# Altium schematic sheet Sheet1.SchDoc
size A3; SheetNumber: 1; SheetTotal: 1
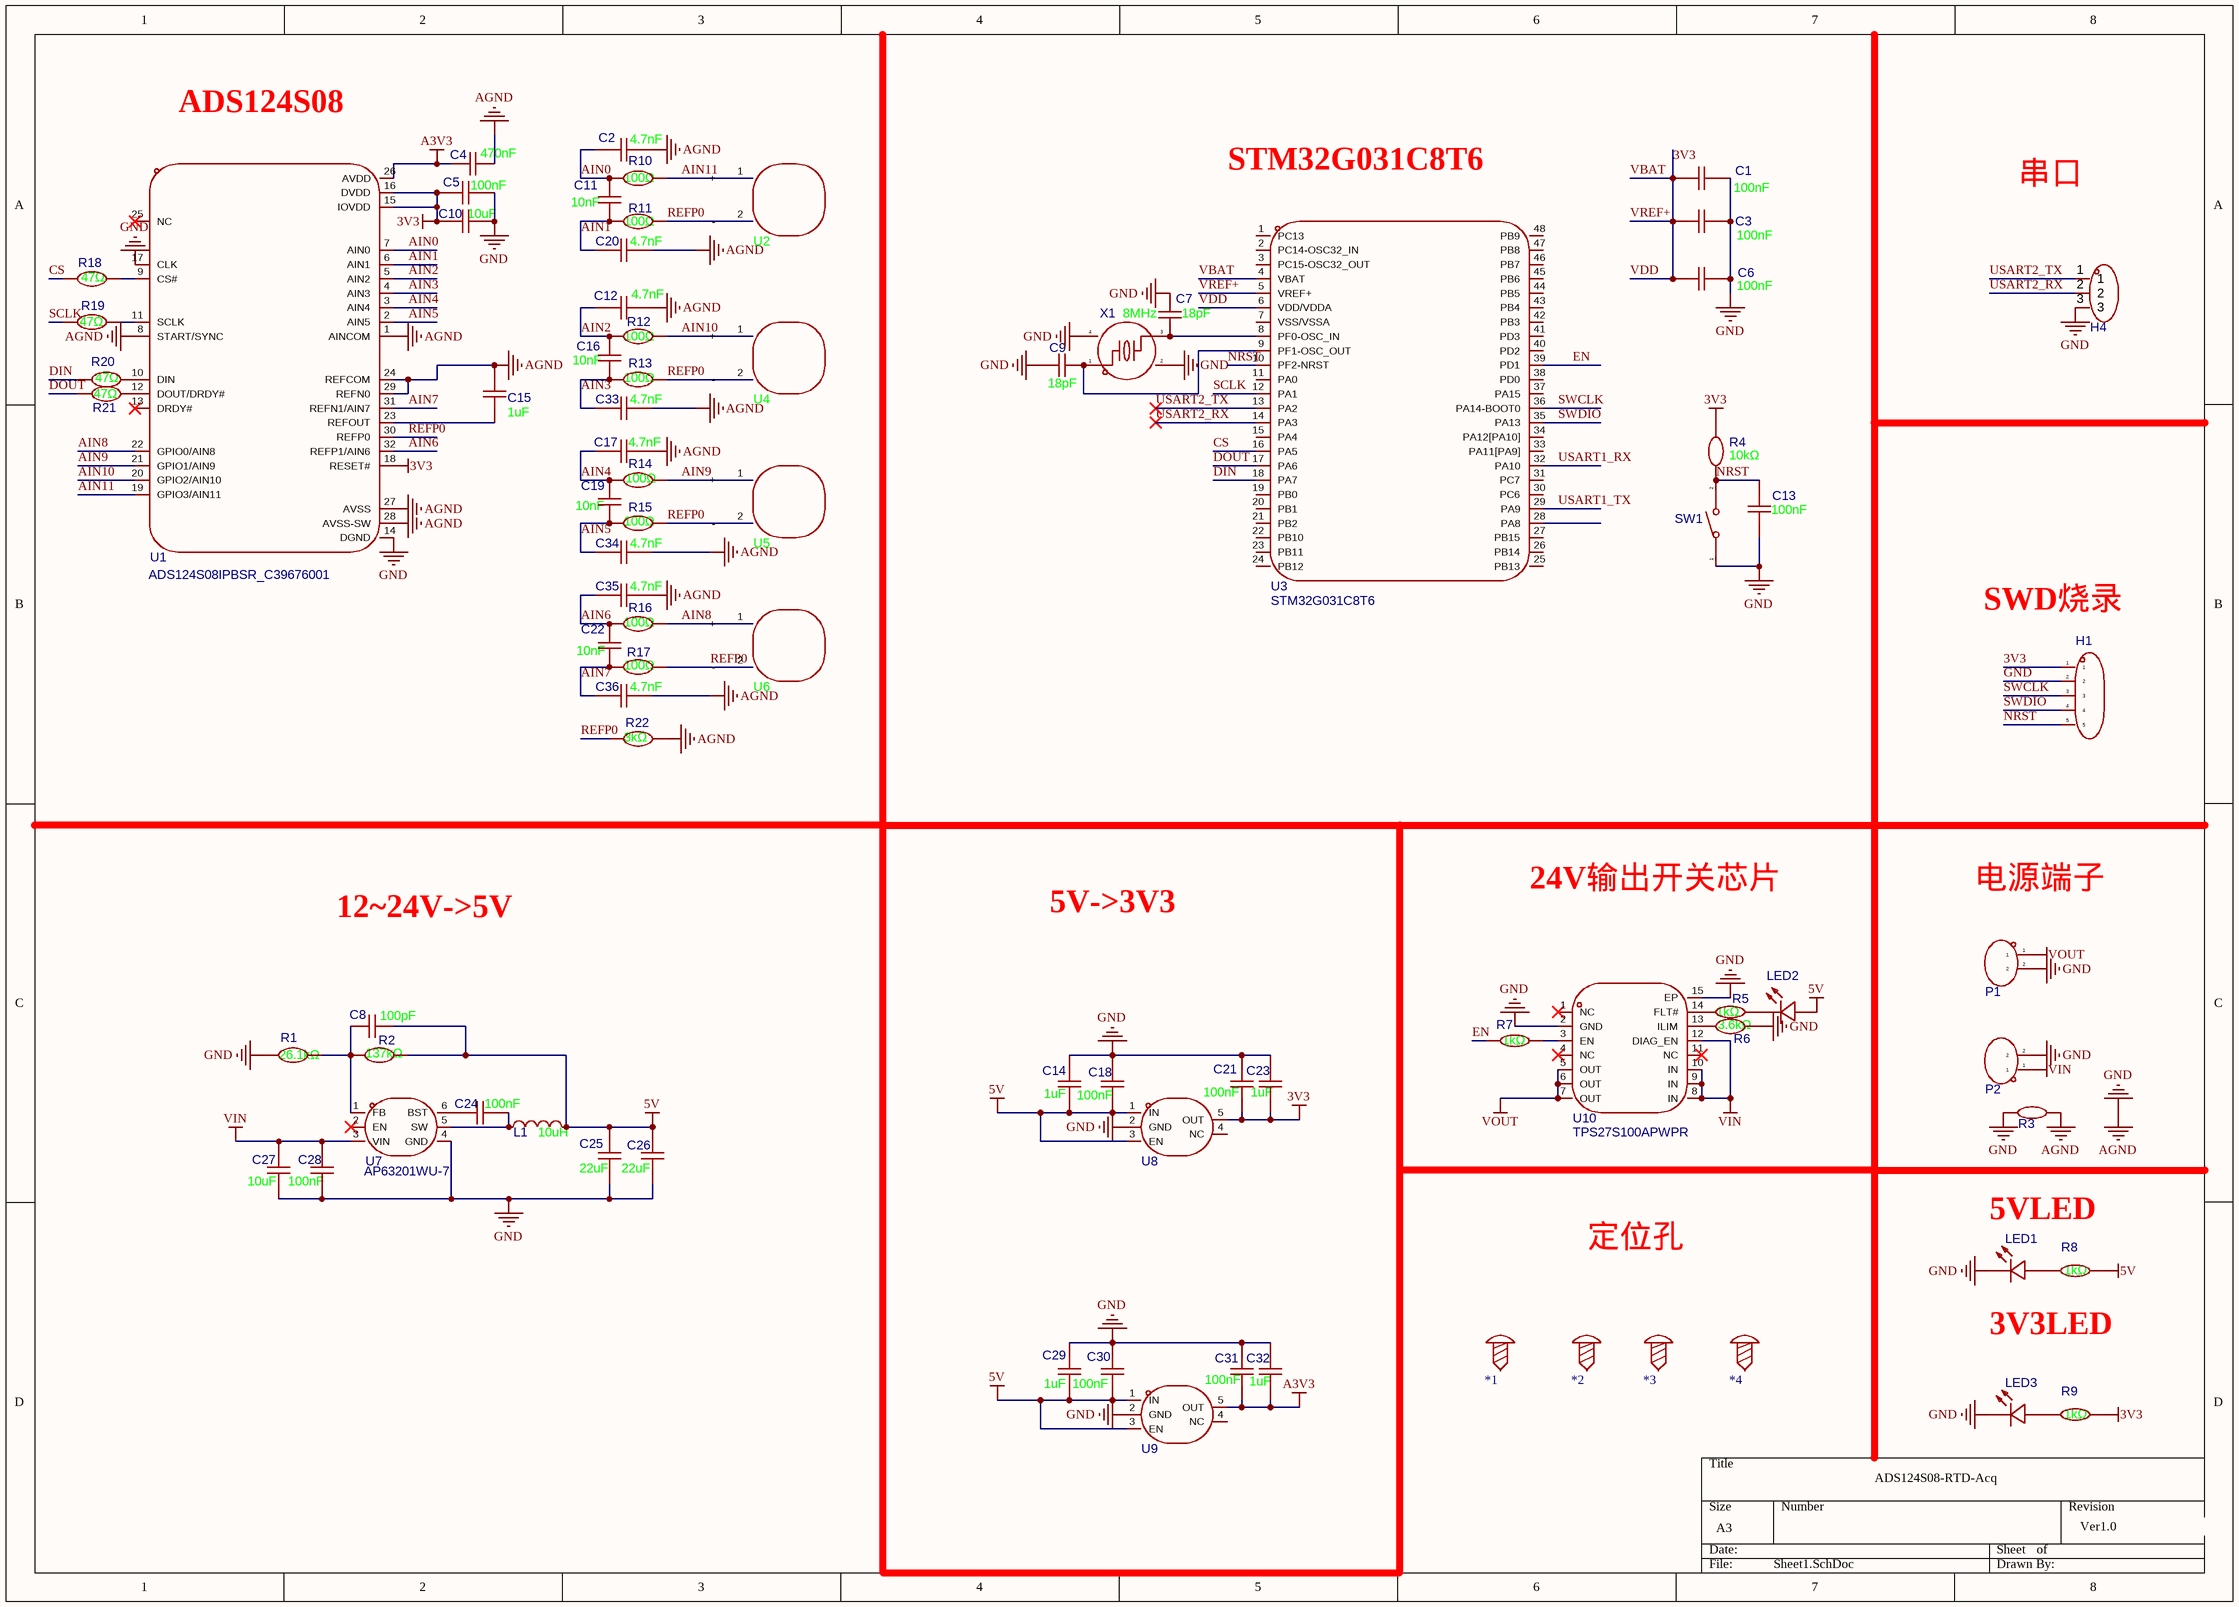
[diagram p0: Sheet1.SchDoc]

## Parts
*1  螺丝孔_1  [M3螺丝]  (value not drawn)
*2  螺丝孔_1  [M3螺丝]  (value not drawn)
*3  螺丝孔_1  [M3螺丝]  (value not drawn)
*4  螺丝孔_1  [M3螺丝]  (value not drawn)
C1  value 100nF  [C0402]  (hidden comment: cc0402krx7r7bb104)
C2  value 4.7nF  [C0402]  (hidden comment: grm1555c1h472je01d)
C3  value 100nF  [C0402]  (hidden comment: cc0402krx7r7bb104)
C4  value 470nF  [C0603]  (hidden comment: cl10b474ka8nnnc)
C5  value 100nF  [C0402]  (hidden comment: cc0402krx7r7bb104)
C6  value 100nF  [C0402]  (hidden comment: cc0402krx7r7bb104)
C7  value 18pF  [C0402]  (hidden comment: cc0402jrnpo9bn180)
C8  value 100pF  [C0402]  (hidden comment: cc0402jrnpo9bn101)
C9  value 18pF  [C0402]  (hidden comment: cc0402jrnpo9bn180)
C10  value 10uF  [C0603]  (hidden comment: hgc0603r5106m350nthj)
C11  value 10nF  [C0805]  (hidden comment: cl21b103kbannnc)
C12  value 4.7nF  [C0402]  (hidden comment: grm1555c1h472je01d)
C13  value 100nF  [C0402]  (hidden comment: cc0402krx7r7bb104)
C14  value 1uF  [C0603]  (hidden comment: cga0603x5r105k500jt)
C15  value 1uF  [C0603]  (hidden comment: cga0603x5r105k500jt)
C16  value 10nF  [C0805]  (hidden comment: cl21b103kbannnc)
C17  value 4.7nF  [C0402]  (hidden comment: grm1555c1h472je01d)
C18  value 100nF  [C0402]  (hidden comment: cc0402krx7r7bb104)
C19  value 10nF  [C0805]  (hidden comment: cl21b103kbannnc)
C20  value 4.7nF  [C0402]  (hidden comment: grm1555c1h472je01d)
C21  value 100nF  [C0402]  (hidden comment: cc0402krx7r7bb104)
C22  value 10nF  [C0805]  (hidden comment: cl21b103kbannnc)
C23  value 1uF  [C0603]  (hidden comment: cga0603x5r105k500jt)
C24  value 100nF  [C0603]  (hidden comment: cga0603x7r104k500jt)
C25  value 22uF  [C0603]  (hidden comment: hgc0603r5226m160nthj)
C26  value 22uF  [C0603]  (hidden comment: hgc0603r5226m160nthj)
C27  value 10uF  [C0603]  (hidden comment: hgc0603r5106m350nthj)
C28  value 100nF  [C0603]  (hidden comment: cga0603x7r104k500jt)
C29  value 1uF  [C0603]  (hidden comment: cga0603x5r105k500jt)
C30  value 100nF  [C0402]  (hidden comment: cc0402krx7r7bb104)
C31  value 100nF  [C0402]  (hidden comment: cc0402krx7r7bb104)
C32  value 1uF  [C0603]  (hidden comment: cga0603x5r105k500jt)
C33  value 4.7nF  [C0402]  (hidden comment: grm1555c1h472je01d)
C34  value 4.7nF  [C0402]  (hidden comment: grm1555c1h472je01d)
C35  value 4.7nF  [C0402]  (hidden comment: grm1555c1h472je01d)
C36  value 4.7nF  [C0402]  (hidden comment: grm1555c1h472je01d)
H1  pz254v-11-05p  [HDR-TH_5P-P2.54-V-M]  (value not drawn)
H4  lail-pz2.54-3p-l  [HDR-TH_3P-P2.54-V-M-1]  (value not drawn)
L1  value 10uH  [IND-SMD_L4.0-W4.0]  (hidden comment: wpn4020h100mt)
LED1  ltst-c190kskt  [LED0603-RD]  (value not drawn)
LED2  ltst-c190kskt  [LED0603-RD]  (value not drawn)
LED3  ltst-c190kskt  [LED0603-RD]  (value not drawn)
P1  wj15edgrc-3.81-02p-14-00a  [CONN-TH_2P-P3.81_WJ15EDGRC-3.81-2P]  (value not drawn)
P2  wj15edgrc-3.81-02p-14-00a  [CONN-TH_2P-P3.81_WJ15EDGRC-3.81-2P]  (value not drawn)
R1  value 26.1kΩ  [R0402]  (hidden comment: rt0402brd0726k1l)
R2  value 137kΩ  [R0402]  (hidden comment: frc0402f1373ts)
R3  0603waf0000t5e  [R0603]  (value not drawn)
R4  value 10kΩ  [R0603]  (hidden comment: frc0603f1002ts)
R5  value 1kΩ  [R0603]  (hidden comment: 0603waf1001t5e)
R6  value 3.6kΩ  [R0603]  (hidden comment: frc0603f3601ts)
R7  value 1kΩ  [R0603]  (hidden comment: 0603waf1001t5e)
R8  value 1kΩ  [R0603]  (hidden comment: 0603waf1001t5e)
R9  value 1kΩ  [R0603]  (hidden comment: 0603waf1001t5e)
R10  value 100Ω  [R0603]  (hidden comment: frc0603f1000ts)
R11  value 100Ω  [R0603]  (hidden comment: frc0603f1000ts)
R12  value 100Ω  [R0603]  (hidden comment: frc0603f1000ts)
R13  value 100Ω  [R0603]  (hidden comment: frc0603f1000ts)
R14  value 100Ω  [R0603]  (hidden comment: frc0603f1000ts)
R15  value 100Ω  [R0603]  (hidden comment: frc0603f1000ts)
R16  value 100Ω  [R0603]  (hidden comment: frc0603f1000ts)
R17  value 100Ω  [R0603]  (hidden comment: frc0603f1000ts)
R18  value 47Ω  [R0402]  (hidden comment: frc0402f47r0ts)
R19  value 47Ω  [R0402]  (hidden comment: frc0402f47r0ts)
R20  value 47Ω  [R0402]  (hidden comment: frc0402f47r0ts)
R21  value 47Ω  [R0402]  (hidden comment: frc0402f47r0ts)
R22  value 3kΩ  [R0805]  (hidden comment: frc0805f3001ts)
SW1  ts-1088-ar02016  [SW-SMD_L3.9-W3.0-P4.45]  (value not drawn)
U1  ads124s08ipbsr_c39676001  [TQFP-32_L5.0-W5.0-P0.50-LS7.0-BL]
U2  pt1000焊盘  [PT1000焊盘]  (value not drawn)
U3  stm32g031c8t6  [LQFP-48_L7.0-W7.0-P0.50-LS9.0-BL]
U4  pt1000焊盘  [PT1000焊盘]  (value not drawn)
U5  pt1000焊盘  [PT1000焊盘]  (value not drawn)
U6  pt1000焊盘  [PT1000焊盘]  (value not drawn)
U7  ap63201wu-7  [TSOT-23-6_L2.9-W1.6-P0.95-LS2.8-BR]
U8  tps7a2033pdbvr  [SOT-23-5_L2.9-W1.6-P0.95-LS2.8-BR]  (value not drawn)
U9  tps7a2033pdbvr  [SOT-23-5_L2.9-W1.6-P0.95-LS2.8-BR]  (value not drawn)
U10  tps27s100apwpr  [TSSOP-14_L5.0-W4.4-P0.65-LS6.4-BL-EP]
X1  value 8MHz  [CRYSTAL-SMD_4P-L3.2-W2.5-BL]  (hidden comment: x32258mob4si)

## Nets
3V3: C1.1 C3.1 C5.2 C6.1 C10.1 C21.1 C23.1 H1.1 R4.2 R9.2 U1.15(IOVDD) U1.16(DVDD) U1.18(RESET#) U3.4(VBAT) U3.5(VREF+) U3.6(VDD/VDDA) U8.5(OUT)  [also labelled VBAT, VDD, VREF+]
5V: C8.2 C14.1 C18.1 C25.2 C26.2 C29.1 C30.1 L1.2 LED2.2(+) R2.1 R8.2 U8.1(IN) U8.3(EN) U9.1(IN) U9.3(EN)
A3V3: C4.1 C31.1 C32.1 U1.26(AVDD) U9.5(OUT)
GND: C1.2 C2.2 C3.2 C4.2 C5.1 C6.2 C7.2 C9.1 C10.2 C12.2 C13.1 C14.2 C15.2 C17.2 C18.2 C20.2 C21.2 C23.2 C25.1 C26.1 C27.1 C28.1 C29.2 C30.2 C31.2 C32.2 C33.2 C34.2 C35.2 C36.2 H1.2 H4.3 LED1.1(-) LED3.1(-) P1.2 P2.2 R1.1 R3.1 R3.2 R6.2 R22.2 SW1.1 U1.1(AINCOM) U1.8(START/SYNC) U1.14(DGND) U1.17(CLK) U1.24(REFCOM) U1.27(AVSS) U1.28(AVSS-SW) U1.29(REFN0) U7.4(GND) U8.2(GND) U9.2(GND) U10.2(GND) U10.15(EP) X1.2(GND) X1.4(GND)  [also labelled AGND]
VIN: C27.2 C28.2 P2.1 U7.3(VIN) U10.8(IN) U10.9(IN) U10.10(IN) U10.12(DIAG_EN)
VOUT: P1.1 U10.5(OUT) U10.6(OUT) U10.7(OUT)
AIN0: C2.1 C11.2 R10.1 U1.7(AIN0)
AIN1: C11.1 C20.1 R11.1 U1.6(AIN1)
AIN2: C12.1 C16.2 R12.1 U1.5(AIN2)
AIN3: C16.1 C33.1 R13.1 U1.4(AIN3)
AIN4: C17.1 C19.2 R14.1 U1.3(AIN4)
AIN5: C19.1 C34.1 R15.1 U1.2(AIN5)
AIN6: C22.2 C35.1 R16.1 U1.32(REFP1/AIN6)
AIN7: C22.1 C36.1 R17.1 U1.31(REFN1/AIN7)
AIN8: R16.2 U1.22(GPIO0/AIN8) U6.1(+)
AIN9: R14.2 U1.21(GPIO1/AIN9) U5.1(+)
AIN10: R12.2 U1.20(GPIO2/AIN10) U4.1(+)
AIN11: R10.2 U1.19(GPIO3/AIN11) U2.1(+)
CS: R18.1 U3.16(PA5)
DIN: R20.1 U3.18(PA7)
DOUT: R21.1 U3.17(PA6)
EN: R7.1 U3.39(PD1)
NRST: C13.2 H1.5 R4.1 SW1.2 U3.10(PF2-NRST)
REFP0: R11.2 R13.2 R15.2 R17.2 R22.1 U1.30(REFP0) U2.2(-) U4.2(-) U5.2(-) U6.2(-)
SCLK: R19.1 U3.12(PA1)
SWCLK: H1.3 U3.36(PA14-BOOT0)
SWDIO: H1.4 U3.35(PA13)
USART1_RX: U3.32(PA10)
USART1_TX: U3.29(PA9)
USART2_RX: H4.2 U3.14(PA3)
USART2_TX: H4.1 U3.13(PA2)
NetC7_1: C7.1 U3.8(PF0-OSC_IN) X1.3
NetC8_1: C8.1 R1.2 R2.2 U7.1(FB)
NetC9_2: C9.2 U3.9(PF1-OSC_OUT) X1.1
NetC15_1: C15.1 U1.23(REFOUT)
NetC24_1: C24.1 L1.1 U7.5(SW)
NetC24_2: C24.2 U7.6(BST)
NetLED1_2: LED1.2(+) R8.1
NetLED2_1: LED2.1(-) R5.2
NetLED3_2: LED3.2(+) R9.1
NetR5_1: R5.1 U10.14(FLT#)
NetR6_1: R6.1 U10.13(ILIM)
NetR7_2: R7.2 U10.3(EN)
NetR18_2: R18.2 U1.9(CS#)
NetR19_2: R19.2 U1.11(SCLK)
NetR20_2: R20.2 U1.10(DIN)
NetR21_2: R21.2 U1.12(DOUT/DRDY#)

Not connected (* = marked no-connect by the designer): *1 1; *2 1; *3 1; *4 1; U1 13(DRDY#)* 25(NC)*; U3 1(PC13) 2(PC14-OSC32_IN) 3(PC15-OSC32_OUT) 7(VSS/VSSA) 11(PA0) 15(PA4) 19(PB0) 20(PB1) 21(PB2) 22(PB10) 23(PB11) 24(PB12) 25(PB13) 26(PB14) 27(PB15) 28(PA8) 30(PC6) 31(PC7) 33(PA11[PA9]) 34(PA12[PA10]) 37(PA15) 38(PD0) 40(PD2) 41(PD3) 42(PB3) 43(PB4) 44(PB5) 45(PB6) 46(PB7) 47(PB8) 48(PB9); U7 2(EN)*; U8 4(NC); U9 4(NC); U10 1(NC)* 4(NC)* 11(NC)*

## Notes on the sheet
- ADS124S08
- STM32G031C8T6
- 串口
- (near H1) SWD烧录
- 24V输出开关芯片
- 电源端子
- 12~24V->5V
- 5V->3V3
- 定位孔
- 5VLED
- 3V3LED
- ADS124S08‑RTD‑Acq
- Ver1.0

## Library data of the parts
C1 C3 C5 C6 C13 C18 C21 C30 C31 = cc0402krx7r7bb104: 容值:100nF;精度:±10%;额定电压:16V;温度系数:X7R;; Manufacturer: YAGEO(国巨); AddInBom: yes; ModelId: 36a51122f27c49738f86b3bfa98863e0; ModelName: C0402_L1.0-W0.5-H0.5; ModelTransform: 39.37,19.685,0,0,0,0,0,0,0; Tolerance: ±10%; Voltage Rating: 16V; Temperature Coefficient: X7R; Symbol: CC0402KRX7R7BB104; LCSC Part Name: 100nF ±10% 16V; SupplierPart: C60474; ManufacturerPart: CC0402KRX7R7BB104; Supplier Footprint: 0402; JLCPCB Part Class: Extended Part; Datasheet: https://item.szlcsc.com/datasheet/CC0402KRX7R7BB104/61526.html; Supplier: LCSC; ConvertToPcb: yes; FootprintName: C0402
C2 C12 C17 C20 C33-C36 = grm1555c1h472je01d: 容值:4.7nF;精度:±5%;额定电压:50V;温度系数:C0G;; Manufacturer: muRata(村田); AddInBom: yes; ModelId: 36a51122f27c49738f86b3bfa98863e0; ModelName: C0402_L1.0-W0.5-H0.5; ModelTransform: 39.37,19.685,0,0,0,0,0,0,0; Tolerance: ±5%; Voltage Rating: 50V; Temperature Coefficient: C0G; Symbol: GRM1555C1H472JE01D; LCSC Part Name: 4.7nF ±5% 50V; SupplierPart: C1518204; ManufacturerPart: GRM1555C1H472JE01D; Supplier Footprint: 0402; JLCPCB Part Class: Extended Part; Datasheet: https://item.szlcsc.com/datasheet/GRM1555C1H472JE01D/1609001.html; Supplier: LCSC; ConvertToPcb: yes; FootprintName: C0402
C4 = cl10b474ka8nnnc: 容值:470nF;精度:±10%;额定电压:25V;温度系数:X7R;; Manufacturer: SAMSUNG(三星); AddInBom: yes; ModelId: ac125912035d415993ca9572d50418b1; ModelName: C0603_L1.6-W0.8-H0.8; ModelTransform: 62.992,31.496,0,0,0,0,0,0,0; Tolerance: ±10%; Voltage Rating: 25V; Temperature Coefficient: X7R; Symbol: CL10B474KA8NNNC; LCSC Part Name: 470nF ±10% 25V; SupplierPart: C1623; ManufacturerPart: CL10B474KA8NNNC; Supplier Footprint: 0603; JLCPCB Part Class: Basic Part; Datasheet: https://item.szlcsc.com/datasheet/CL10B474KA8NNNC/1975.html; Supplier: LCSC; ConvertToPcb: yes; FootprintName: C0603
C7 C9 = cc0402jrnpo9bn180: 容值:18pF;精度:±5%;额定电压:50V;温度系数:NP0;; Manufacturer: YAGEO(国巨); AddInBom: yes; ModelId: 36a51122f27c49738f86b3bfa98863e0; ModelName: C0402_L1.0-W0.5-H0.5; ModelTransform: 39.37,19.685,0,0,0,0,0,0,0; Tolerance: ±5%; Voltage Rating: 50V; Temperature Coefficient: NP0; Symbol: CC0402JRNPO9BN180; LCSC Part Name: 18pF ±5% 50V; SupplierPart: C106202; ManufacturerPart: CC0402JRNPO9BN180; Supplier Footprint: 0402; JLCPCB Part Class: Extended Part; Datasheet: https://item.szlcsc.com/datasheet/CC0402JRNPO9BN180/107417.html; Supplier: LCSC; ConvertToPcb: yes; FootprintName: C0402
C8 = cc0402jrnpo9bn101: 容值:100pF;精度:±5%;额定电压:50V;温度系数:NP0;; Manufacturer: YAGEO(国巨); AddInBom: yes; ModelId: 36a51122f27c49738f86b3bfa98863e0; ModelName: C0402_L1.0-W0.5-H0.5; ModelTransform: 39.37,19.685,0,0,0,0,0,0,0; Tolerance: ±5%; Voltage Rating: 50V; Temperature Coefficient: NP0; Symbol: CC0402JRNPO9BN101; LCSC Part Name: 100pF ±5% 50V; SupplierPart: C106200; ManufacturerPart: CC0402JRNPO9BN101; Supplier Footprint: 0402; JLCPCB Part Class: Extended Part; Datasheet: https://item.szlcsc.com/datasheet/CC0402JRNPO9BN101/107415.html; Supplier: LCSC; ConvertToPcb: yes; FootprintName: C0402
C10 C27 = hgc0603r5106m350nthj: 容值:10uF;精度:±20%;额定电压:35V;温度系数:X5R;; Manufacturer: Chinocera(华瓷); AddInBom: yes; ModelId: ac125912035d415993ca9572d50418b1; ModelName: C0603_L1.6-W0.8-H0.8; ModelTransform: 62.992,31.496,0,0,0,0,0,0,0; Tolerance: ±20%; Voltage Rating: 35V; Temperature Coefficient: X5R; Symbol: HGC0603R5106M350NTHJ; LCSC Part Name: 10uF ±20% 35V; SupplierPart: C22367827; ManufacturerPart: HGC0603R5106M350NTHJ; Supplier Footprint: 0603; JLCPCB Part Class: Extended Part; Datasheet: https://item.szlcsc.com/datasheet/HGC0603R5106M350NTHJ/23841132.html; Supplier: LCSC; ConvertToPcb: yes; FootprintName: C0603
C11 C16 C19 C22 = cl21b103kbannnc: 容值:10nF;精度:±10%;额定电压:50V;温度系数:X7R;; Manufacturer: SAMSUNG(三星); AddInBom: yes; ModelId: 1ba041120af144c991958decab20d241; ModelName: C0805_L2.0-W1.3-H1.3; ModelTransform: 78.74,51.181,0,0,0,0,0,0.0005,0; Tolerance: ±10%; Voltage Rating: 50V; Temperature Coefficient: X7R; Symbol: CL21B103KBANNNC; LCSC Part Name: 10nF ±10% 50V; SupplierPart: C1710; ManufacturerPart: CL21B103KBANNNC; Supplier Footprint: 0805; JLCPCB Part Class: Basic Part; Datasheet: https://item.szlcsc.com/datasheet/CL21B103KBANNNC/2062.html; Supplier: LCSC; ConvertToPcb: yes; FootprintName: C0805
C14 C15 C23 C29 C32 = cga0603x5r105k500jt: 容值:1uF;精度:±10%;额定电压:50V;温度系数:X5R;; Manufacturer: HRE(芯声); AddInBom: yes; ModelId: ac125912035d415993ca9572d50418b1; ModelName: C0603_L1.6-W0.8-H0.8; ModelTransform: 62.992,31.496,0,0,0,0,0,0,0; Tolerance: ±10%; Voltage Rating: 50V; Temperature Coefficient: X5R; Symbol: CGA0603X5R105K500JT; LCSC Part Name: 1uF ±10% 50V 停产; SupplierPart: C6119852; ManufacturerPart: CGA0603X5R105K500JT; Supplier Footprint: 0603; JLCPCB Part Class: Extended Part; Datasheet: https://item.szlcsc.com/datasheet/CGA0603X5R105K500JT/7062558.html; Supplier: LCSC; ConvertToPcb: yes; FootprintName: C0603
C24 C28 = cga0603x7r104k500jt: 容值:100nF;精度:±10%;额定电压:50V;温度系数:X7R;; Manufacturer: HRE(芯声); AddInBom: yes; ModelId: ac125912035d415993ca9572d50418b1; ModelName: C0603_L1.6-W0.8-H0.8; ModelTransform: 62.992,31.496,0,0,0,0,0,0,0; Tolerance: ±10%; Voltage Rating: 50V; Temperature Coefficient: X7R; Symbol: CGA0603X7R104K500JT; LCSC Part Name: 100nF ±10% 50V; SupplierPart: C6119867; ManufacturerPart: CGA0603X7R104K500JT; Supplier Footprint: 0603; JLCPCB Part Class: Extended Part; Datasheet: https://item.szlcsc.com/datasheet/CGA0603X7R104K500JT/7062573.html; Supplier: LCSC; ConvertToPcb: yes; FootprintName: C0603
C25 C26 = hgc0603r5226m160nthj: 容值:22uF;精度:±20%;额定电压:16V;温度系数:X5R;; Manufacturer: Chinocera(华瓷); AddInBom: yes; ModelId: ac125912035d415993ca9572d50418b1; ModelName: C0603_L1.6-W0.8-H0.8; ModelTransform: 62.992,31.496,0,0,0,0,0,0,0; Tolerance: ±20%; Voltage Rating: 16V; Temperature Coefficient: X5R; Symbol: HGC0603R5226M160NTHJ; LCSC Part Name: 22uF ±20% 16V; SupplierPart: C22367828; ManufacturerPart: HGC0603R5226M160NTHJ; Supplier Footprint: 0603; JLCPCB Part Class: Extended Part; Datasheet: https://item.szlcsc.com/datasheet/HGC0603R5226M160NTHJ/23841133.html; Supplier: LCSC; ConvertToPcb: yes; FootprintName: C0603
H1 = pz254v-11-05p: 插针结构:1x5P;间距:2.54mm;行距:-;圆针/方针:方针;安装方式:直插;排数:单排;总PIN位数:5P;额定电流:3A;额定电压:250V;配合针长度:6mm;塑高:2.5mm;端接针长度:3mm;触头材质:黄铜;触头镀层:-;工作温度:-40℃~+105℃;颜色:黑色;; Manufacturer: XFCN(兴飞); AddInBom: yes; ModelId: 47d466e4a34f4fc5bc626cf773a24dd5; ModelName: HDR-TH_5P-P2.54-M-LI-1X5P; ModelTransform: 499.999,100,0,0,0,0,0,0,-118.11; Pin Structure: 1x5P; Pitch: 2.54mm; Circluar Pins/Square Pins: 方针; Current Rating: 3A; Voltage Rating (Max): 250V; Symbol: PZ254V-11-05P; LCSC Part Name: 1x5P 间距:2.54mm 方针 直插; SupplierPart: C492404; ManufacturerPart: PZ254V-11-05P; Supplier Footprint: 插件,P=2.54mm; JLCPCB Part Class: Extended Part; Datasheet: https://item.szlcsc.com/datasheet/PZ254V-11-05P/502960.html; Supplier: LCSC; ConvertToPcb: yes; FootprintName: HDR-TH_5P-P2.54-V-M; Row Spacing: -; Mounting Type: 直插; Number of Rows: 单排; Number of Pins: 5P; Length of Mating Pin: 6mm; Insulation Height: 2.5mm; Length of End Connection Pin: 3mm; Contact Material: 黄铜; Contact Plating: -; Operating Temperature: -40℃~+105℃; Color: 黑色
H4 = lail-pz2.54-3p-l: 插针结构:1x3P;间距:2.54mm;圆针/方针:方针;排数:单排;总PIN位数:3P;额定电流:3A;额定电压:250V;塑高:2.5mm;端接针长度:3mm;触头材质:黄铜;触头镀层:金;工作温度:-25℃~+80℃;颜色:黑色;; Manufacturer: LAILAN(莱联); AddInBom: yes; ModelId: 94a8ffe137b6410295cb18cd3ffd99db; ModelName: HDR-M-2.54_1x3; ModelTransform: 299.9994,100,0,0,0,0,0,0,-118.11; Pin Structure: 1x3P; Pitch: 2.54mm; Circluar Pins/Square Pins: 方针; Current Rating: 3A; Voltage Rating (Max): 250V; LCSC Part Name: 1x3P 间距:2.54mm 方针; SupplierPart: C54950604; ManufacturerPart: LAIL-PZ2.54-3P-L; Supplier Footprint: 插件,P=2.54mm; JLCPCB Part Class: Extended Part; Datasheet: https://item.szlcsc.com/datasheet/LAIL-PZ2.54-3P-L/58519957.html; Supplier: LCSC; ConvertToPcb: yes; SymbolName: LAIL-PZ2.54-3P-L; FootprintName: HDR-TH_3P-P2.54-V-M-1; Number of Rows: 单排; Number of Pins: 3P; Insulation Height: 2.5mm; Length of End Connection Pin: 3mm; Contact Material: 黄铜; Contact Plating: 金; Operating Temperature: -25℃~+80℃; Color: 黑色
L1 = wpn4020h100mt: 电感值:10uH;精度:±20%;额定电流:2A;饱和电流(Isat):3.5A;类型:-;; Manufacturer: Sunlord(顺络); AddInBom: yes; ModelId: 45bc3737ecfd4f3bb122605ee525b018; ModelName: IND-SMD_L4.0-W4.0-H1.9; ModelTransform: 157.48,157.484,0,0,0,0,0,0,0; Tolerance: ±20%; Current Rating: 2A; Current - Saturation(Isat): 3.5A; DC Resistance(DCR): 216mΩ; Symbol: WPN4020H100MT; LCSC Part Name: 10uH ±20% 3.5A; SupplierPart: C98364; ManufacturerPart: WPN4020H100MT; Supplier Footprint: SMD,4x4mm; JLCPCB Part Class: Extended Part; Datasheet: https://item.szlcsc.com/datasheet/WPN4020H100MT/99573.html; Supplier: LCSC; ConvertToPcb: yes; FootprintName: IND-SMD_L4.0-W4.0; Type: -; Ratings: -
LED1-LED3 = ltst-c190kskt: 灯头类型:-;发光颜色:黄色;正向压降(Vf):2.1V;功率:75mW;正向电流:20mA;波长:584.5nm~597nm;二极管配置:独立二极管;透镜颜色:无色透明透镜;色温:-;发光强度:104mcd;发光角度:130°;载带方式:-;工作温度:-30℃~+85℃;; Manufacturer: LITEON(光宝); AddInBom: yes; ModelId: 1f0d29a91be547639d425604e9b96ebb; ModelTransform: 63.7794,32.283,0,0,0,0,0,0,0; Illumination Color: 黄色; Voltage - Forward(Vf): 2.1V; Power(Watts): 75mW; Forward Current: 20mA; Peak Wavelength: 588nm; Diode Configuration: 独立二极管; Lens Color: 无色透明透镜; Luminous Intensity: 104mcd; Viewing Angle: 130°; Symbol: LTST-C190KSKT; LCSC Part Name: 黄灯; SupplierPart: C125095; ManufacturerPart: LTST-C190KSKT; Supplier Footprint: 0603; JLCPCB Part Class: Extended Part; Datasheet: https://item.szlcsc.com/datasheet/LTST-C190KSKT/136371.html; Supplier: LCSC; ConvertToPcb: yes; FootprintName: LED0603-RD; ModelName: LED0603-RD; Lamp Holder Type: -; Wavelength - Dominant: 584.5nm~597nm; Color Temperature: -; Mounting Style: -; Operating Temperature: -30℃~+85℃
P1 P2 = wj15edgrc-3.81-02p-14-00a: 连接器类型:板端/插座-闭口;固定方式:无固定装置;结构:1x2P;间距:3.81mm;颜色:绿色;安装方式:弯插;排数:1;每排PIN数:2;额定电流:8A;额定电压:300V;线规 - AWG:-;线规 - 平方毫米:-;工作温度:-40℃~+105℃;; Manufacturer: KANGNEX(康奈克斯电气); Symbol: WJ15EDGRC-3.81-2P; AddInBom: yes; ModelId: 816ec8aca6fe4785be70cb4c5121258d; ModelName: CONN-TH_2P_L8.5-W9.2-H7.0-P3.81; ModelTransform: 334.645,360.2355,0,0,0,0,0,-118.11,-137.795; Number of Positions or Pins: 1x2P; Pitch: 3.81mm; Number of PINs Per Row: 2; Current Rating: 8A; Voltage Rating (Max): 300V; LCSC Part Name: 无固定装置 1x2P 3.81mm 排数:1 每排P数:2; SupplierPart: C8387; ManufacturerPart: WJ15EDGRC-3.81-02P-14-00A; Supplier Footprint: 弯插,P=3.81mm; JLCPCB Part Class: Extended Part; Datasheet: https://item.szlcsc.com/datasheet/WJ15EDGRC-3.81-02P-14-00A/8881.html; Supplier: LCSC; ConvertToPcb: yes; FootprintName: CONN-TH_2P-P3.81_WJ15EDGRC-3.81-2P; Connector Type: 板端/插座-闭口; Termination Style: 无固定装置; Color: 绿色; Mounting Type: 弯插; Number of Pins: 2P; Number of Rows: 1; Wire Gauge - AWG: -; Wire Gauge - mm2: -; Operating Temperature: -40℃~+105℃; Connection Type: -; Outlet Direction (Vertical Basis): -
R1 = rt0402brd0726k1l: 电阻类型:薄膜电阻;阻值:26.1kΩ;精度:±0.1%;功率:62.5mW;工作电压:50V;温度系数:±25ppm/℃;; Manufacturer: YAGEO(国巨); AddInBom: yes; ModelId: 98c88bc2b9094f218f3a3e30a7012738; ModelName: R0402_L1.0-W0.5-H0.4; ModelTransform: 39.37,19.685,0,0,0,0,0,0,0; Tolerance: ±0.1%; Power(Watts): 62.5mW; Voltage-Supply(Max): 50V; Symbol: RT0402BRD0726K1L; LCSC Part Name: 薄膜电阻 26.1kΩ ±0.1% 62.5mW; SupplierPart: C728557; ManufacturerPart: RT0402BRD0726K1L; Supplier Footprint: 0402; JLCPCB Part Class: Extended Part; Datasheet: https://item.szlcsc.com/datasheet/RT0402BRD0726K1L/775872.html; Supplier: LCSC; ConvertToPcb: yes; FootprintName: R0402; Type: 薄膜电阻; Temperature Coefficient: ±25ppm/℃; Operating Temperature: -55℃~+155℃
R2 = frc0402f1373ts: 电阻类型:厚膜电阻;阻值:137kΩ;精度:±1%;功率:62.5mW;工作电压:50V;温度系数:±100ppm/℃;; Manufacturer: FOJAN(富捷); AddInBom: yes; ModelId: 98c88bc2b9094f218f3a3e30a7012738; ModelName: R0402_L1.0-W0.5-H0.4; ModelTransform: 39.37,19.685,0,0,0,0,0,0,0; Tolerance: ±1%; Power(Watts): 62.5mW; Voltage-Supply(Max): 50V; Symbol: FRC0402F1373TS; LCSC Part Name: 137kΩ ±1% 62.5mW 厚膜电阻; SupplierPart: C5153963; ManufacturerPart: FRC0402F1373TS; Supplier Footprint: 0402; JLCPCB Part Class: Extended Part; Datasheet: https://item.szlcsc.com/datasheet/FRC0402F1373TS/5781091.html; Supplier: LCSC; ConvertToPcb: yes; FootprintName: R0402; Type: 厚膜电阻; Temperature Coefficient: ±100ppm/℃; Operating Temperature: -55℃~+155℃
R3 = 0603waf0000t5e: 电阻类型:厚膜电阻;阻值:0Ω;精度:±1%;功率:100mW;工作电压:75V;温度系数:-;; Manufacturer: UNI-ROYAL(厚声); AddInBom: yes; ModelId: fc143cca1e79419f9cd78b61e9279f08; ModelTransform: 31.8897,63.7794,0,90,0,0,0,0,0; Value: 0Ω; Tolerance: ±1%; Power(Watts): 100mW; Voltage-Supply(Max): 75V; Symbol: 0603WAF0000T5E; LCSC Part Name: 0Ω ±1% 100mW 厚膜电阻; SupplierPart: C21189; ManufacturerPart: 0603WAF0000T5E; Supplier Footprint: 0603; JLCPCB Part Class: Basic Part; Datasheet: https://item.szlcsc.com/datasheet/0603WAF0000T5E/21903.html; Supplier: LCSC; ConvertToPcb: yes; FootprintName: R0603; ModelName: R0603; Type: 厚膜电阻; Temperature Coefficient: -; Operating Temperature: -55℃~+155℃
R4 = frc0603f1002ts: 电阻类型:厚膜电阻;阻值:10kΩ;精度:±1%;功率:100mW;工作电压:75V;温度系数:±100ppm/℃;; Manufacturer: FOJAN(富捷); AddInBom: yes; ModelId: fc143cca1e79419f9cd78b61e9279f08; ModelTransform: 31.8897,63.7794,0,90,0,0,0,0,0; Tolerance: ±1%; Power(Watts): 100mW; Voltage-Supply(Max): 75V; Symbol: FRC0603F1002TS; LCSC Part Name: 10kΩ ±1% 100mW 厚膜电阻; SupplierPart: C2906982; ManufacturerPart: FRC0603F1002TS; Supplier Footprint: 0603; JLCPCB Part Class: Extended Part; Datasheet: https://item.szlcsc.com/datasheet/FRC0603F1002TS/3180495.html; Supplier: LCSC; ConvertToPcb: yes; FootprintName: R0603; ModelName: R0603; Type: 厚膜电阻; Temperature Coefficient: ±100ppm/℃; Operating Temperature: -55℃~+155℃
R5 R7-R9 = 0603waf1001t5e: 电阻类型:厚膜电阻;阻值:1kΩ;精度:±1%;功率:100mW;工作电压:75V;温度系数:±100ppm/℃;; Manufacturer: UNI-ROYAL(厚声); AddInBom: yes; ModelId: fc143cca1e79419f9cd78b61e9279f08; ModelTransform: 31.8897,63.7794,0,90,0,0,0,0,0; Tolerance: ±1%; Power(Watts): 100mW; Voltage-Supply(Max): 75V; Symbol: 0603WAF1001T5E; LCSC Part Name: 1kΩ ±1% 100mW 厚膜电阻; SupplierPart: C21190; ManufacturerPart: 0603WAF1001T5E; Supplier Footprint: 0603; JLCPCB Part Class: Basic Part; Datasheet: https://item.szlcsc.com/datasheet/0603WAF1001T5E/21904.html; Supplier: LCSC; ConvertToPcb: yes; FootprintName: R0603; ModelName: R0603; Type: 厚膜电阻; Temperature Coefficient: ±100ppm/℃; Operating Temperature: -55℃~+155℃
R6 = frc0603f3601ts: 电阻类型:厚膜电阻;阻值:3.6kΩ;精度:±1%;功率:100mW;工作电压:75V;温度系数:±100ppm/℃;; Manufacturer: FOJAN(富捷); AddInBom: yes; ModelId: fc143cca1e79419f9cd78b61e9279f08; ModelTransform: 31.8897,63.7794,0,90,0,0,0,0,0; Tolerance: ±1%; Power(Watts): 100mW; Voltage-Supply(Max): 75V; Symbol: FRC0603F3601TS; LCSC Part Name: 3.6kΩ ±1% 100mW 厚膜电阻; SupplierPart: C2933208; ManufacturerPart: FRC0603F3601TS; Supplier Footprint: 0603; JLCPCB Part Class: Extended Part; Supplier: LCSC; ConvertToPcb: yes; FootprintName: R0603; ModelName: R0603; Type: 厚膜电阻; Temperature Coefficient: ±100ppm/℃; Operating Temperature: -55℃~+155℃
R10-R17 = frc0603f1000ts: 电阻类型:厚膜电阻;阻值:100Ω;精度:±1%;功率:100mW;工作电压:75V;温度系数:±100ppm/℃;; Manufacturer: FOJAN(富捷); AddInBom: yes; ModelId: fc143cca1e79419f9cd78b61e9279f08; ModelTransform: 31.8897,63.7794,0,90,0,0,0,0,0; Tolerance: ±1%; Power(Watts): 100mW; Voltage-Supply(Max): 75V; Symbol: FRC0603F1000TS; LCSC Part Name: 100Ω ±1% 100mW 厚膜电阻; SupplierPart: C2906981; ManufacturerPart: FRC0603F1000TS; Supplier Footprint: 0603; JLCPCB Part Class: Extended Part; Datasheet: https://item.szlcsc.com/datasheet/FRC0603F1000TS/3180494.html; Supplier: LCSC; ConvertToPcb: yes; FootprintName: R0603; ModelName: R0603; Type: 厚膜电阻; Temperature Coefficient: ±100ppm/℃; Operating Temperature: -55℃~+155℃
R18-R21 = frc0402f47r0ts: 电阻类型:厚膜电阻;阻值:47Ω;精度:±1%;功率:62.5mW;工作电压:50V;温度系数:±100ppm/℃;; Manufacturer: FOJAN(富捷); AddInBom: yes; ModelId: 98c88bc2b9094f218f3a3e30a7012738; ModelName: R0402_L1.0-W0.5-H0.4; ModelTransform: 39.37,19.685,0,0,0,0,0,0,0; Tolerance: ±1%; Power(Watts): 62.5mW; Voltage-Supply(Max): 50V; Symbol: FRC0402F47R0TS; LCSC Part Name: 47Ω ±1% 62.5mW 厚膜电阻; SupplierPart: C2909362; ManufacturerPart: FRC0402F47R0TS; Supplier Footprint: 0402; JLCPCB Part Class: Extended Part; Datasheet: https://item.szlcsc.com/datasheet/FRC0402F47R0TS/3186297.html; Supplier: LCSC; ConvertToPcb: yes; FootprintName: R0402; Type: 厚膜电阻; Temperature Coefficient: ±100ppm/℃; Operating Temperature: -55℃~+155℃
R22 = frc0805f3001ts: 电阻类型:厚膜电阻;阻值:3kΩ;精度:±1%;功率:125mW;工作电压:150V;温度系数:±100ppm/℃;; Manufacturer: FOJAN(富捷); AddInBom: yes; ModelId: 37a81e68749a4138bd2dfa6897b24b85; ModelName: R0805_L2.0-W1.3-H0.6; ModelTransform: 78.74,51.181,0,0,0,0,0,-0.0005,0; Tolerance: ±1%; Power(Watts): 125mW; Voltage-Supply(Max): 150V; Symbol: FRC0805F3001TS; LCSC Part Name: 3kΩ ±1% 125mW 厚膜电阻; SupplierPart: C2907263; ManufacturerPart: FRC0805F3001TS; Supplier Footprint: 0805; JLCPCB Part Class: Extended Part; Datasheet: https://item.szlcsc.com/datasheet/FRC0805F3001TS/3180776.html; Supplier: LCSC; ConvertToPcb: yes; FootprintName: R0805; Type: 厚膜电阻; Temperature Coefficient: ±100ppm/℃; Operating Temperature: -55℃~+155℃
SW1 = ts-1088-ar02016: 电路结构:单刀单掷;按钮形状:圆形按钮;作用力:1.6N;安装方式:立贴;开关长度:3.9mm;开关宽度:3mm;开关高度:2mm;带支架:不带支架;触点电流:50mA;额定电压:12V;带灯:-;工作寿命:10万次;; Manufacturer: XUNPU(讯普); AddInBom: yes; ModelId: b26698b69f274ffabef8a26c7d0e5dd1; ModelName: SW-SMD_L3.9-W2.9-H2.0-LS4.8; ModelTransform: 188.976,114.174,0,0,0,0,0,0,0; Circuit: 单刀单掷; Actuator Style: 圆形按钮; Operating Force: 1.6N; Switch Height: 2mm; with Bracket: 不带支架; Contact Current: 50mA; Voltage Rating: 12V; Actuator/Cap Color: 黑色; Life: 10万次; Symbol: TS-1088-AR02016; LCSC Part Name: 3.9*3*2mm 立贴 轻触开关; SupplierPart: C720477; ManufacturerPart: TS-1088-AR02016; Supplier Footprint: SMD,4x3mm; JLCPCB Part Class: Basic Part; Datasheet: https://item.szlcsc.com/datasheet/TS-1088-AR02016/763484.html; Supplier: LCSC; ConvertToPcb: yes; FootprintName: SW-SMD_L3.9-W3.0-P4.45; Mounting Type: 立贴; Length: 3.9mm; Width: 3mm; With Lamp: -; IP Rating: -; Termination Style: SMD接片; Operating Temperature: -30℃~+80℃
U1 = ads124s08ipbsr_c39676001: 分辨率(位):24;采样率:4kHz;工作电压:2.7V~5.25V;接口类型:SPI;; Manufacturer: TI(德州仪器); AddInBom: yes; ModelId: 0723864a05e7424ab80b3c78d6a7d93a; ModelName: TQFP-32_L5.0-W5.0-H1.2-LS7.0-P0.50; ModelTransform: 277.58783,277.58783,0,90,0,0,0.013,0,0; Resolution (Bits): 24; Sampling Rate: 4kHz; number of channels: 12; Interface: SPI; differential input: 是; Clock/Oscillator: 内置; Clock Frequency: 4.096MHz; Programmable Gain: 支持; Quiescent Current (Iq): 280uA; Symbol: ADS124S08IPBSR_C39676001; LCSC Part Name: 具有PGA和电压基准的低功耗、低噪声、高集成度6通道及12通道4kSPS、24位∑-Δ ADC; SupplierPart: C39676001; ManufacturerPart: ADS124S08IPBSR; Supplier Footprint: TQFP-32(5x5); JLCPCB Part Class: Extended Part; Datasheet: https://www.ti.com.cn/cn/lit/ds/symlink/ads124s08.pdf?ts=1739413233444&ref_url=https%253A%252F%252Fwww.ti.com.cn%252Fproduct%252Fcn%252FADS124S08; Supplier: LCSC; ConvertToPcb: yes; FootprintName: TQFP-32_L5.0-W5.0-P0.50-LS7.0-BL; Voltage - Supply: 2.7V~5.25V; Operating Temperature: -50℃~+125℃; Voltage Reference: 内置; Features: 多路复用器；双极性电源；自动校准；内置温度传感器
U2 U4-U6 = pt1000焊盘: AddInBom: yes; ConvertToPcb: yes
  U4-U6: SymbolName: PT1000焊盘
U3 = stm32g031c8t6: CPU内核:ARM Cortex-M0+;CPU最大主频:64MHz;CPU位数:32 Bit;; Manufacturer: ST(意法半导体); AddInBom: yes; ModelId: 093be70396ff421eb2cdb946d5311efc; ModelName: LQFP-48_L7.0-W7.0-H1.4-LS9.0-P0.50; ModelTransform: 354.331,354.331,0,0,0,0,0,0,0; CPU Maximum Speed: 64MHz; Core Size: 32 Bit; Program Storage Size: 64KB; Program Memory Type: FLASH; RAM Size: 8KB; Number of I/O: 44; ADC (Bit): 12bit; Oscillator Type: 内置+外置; Voltage - Supply: 1.7V~3.6V; Symbol: STM32G031C8T6; LCSC Part Name: 主流Arm Cortex-M0+ MCU，具有64 KB Flash存储器、8 KB RAM、64 MHz CPU、2x USART、定时器、ADC和通信接口，1.7-3.6V; SupplierPart: C432205; ManufacturerPart: STM32G031C8T6; Supplier Footprint: LQFP-48(7x7); JLCPCB Part Class: Extended Part; Datasheet: https://item.szlcsc.com/datasheet/STM32G031C8T6/428993.html; Supplier: LCSC; ConvertToPcb: yes; FootprintName: LQFP-48_L7.0-W7.0-P0.50-LS9.0-BL; CPU Core: ARM Cortex-M0+; EEPROM: -; Operating Temperature: -40℃~+85℃
U7 = ap63201wu-7: 功能类型:降压型;工作电压:3.8V~32V;输出电压:-;输出电流:2A;输出类型:可调;; Manufacturer: DIODES(美台); AddInBom: yes; ModelId: 2c4039b5b88644c1bda4b4ba9e971667; ModelName: TSOT-23-6_L2.9-W1.6-H1.1-LS2.8-P0.95; ModelTransform: 110.45568,114.173,0,180,0,0,-0.005,-0.0005,0; Function: 降压型; Output Current: 2A; Frequency - Switching: 500kHz; Synchronous Rectifier: 是; Number of Outputs: 1; Topology: 降压式; Quiescent Current: 22uA; Switch tube (built-in/external): 内置; Output Type: 可调; Symbol: AP63201WU-7; LCSC Part Name: 降压型 2A 3.8V~32V; SupplierPart: C2071044; ManufacturerPart: AP63201WU-7; Supplier Footprint: TSOT-23-6; JLCPCB Part Class: Extended Part; Datasheet: https://item.szlcsc.com/datasheet/AP63201WU-7/2162627.html; Supplier: LCSC; ConvertToPcb: yes; FootprintName: TSOT-23-6_L2.9-W1.6-P0.95-LS2.8-BR; Voltage - Supply: 3.8V~32V; Output Voltage: -; Operating Temperature: -40℃~+85℃; Features: 轻载高效模式；逐波限流；过流保护；EMI优化(抖频模式)；打嗝限流
U8 U9 = tps7a2033pdbvr: 输出类型:固定;最大输入电压:6V;输出电压:3.3V;输出电流:300mA;输出极性:正极;; Manufacturer: TI(德州仪器); AddInBom: yes; ModelId: 7ba65df16e7b4570af156e925f9c37fe; ModelTransform: 114.173,114.173,0,90,0,0,0,0,0; Output Type: 固定; Maximum Input Voltage: 6V; Output Voltage: 3.3V; Output Current: 300mA; Dropout Voltage: 140mV@(300mA); standby current: 15uA; Output Polarity: 正极; Number of Outputs: 1; Symbol: TPS7A2033PDBVR; LCSC Part Name: 具有高 PSRR 的 300mA、超低噪声、低 IQ、低压降 (LDO) 线性稳压器; SupplierPart: C2862740; ManufacturerPart: TPS7A2033PDBVR; Supplier Footprint: SOT-23-5; JLCPCB Part Class: Extended Part; Datasheet: https://www.ti.com/cn/lit/gpn/tps7a20; Supplier: LCSC; ConvertToPcb: yes; FootprintName: SOT-23-5_L2.9-W1.6-P0.95-LS2.8-BR; ModelName: SOT-23-5_L2.9-W1.6-P0.95-LS2.8-BR; Feature: 防静电保护；软启动；浪涌保护；低ESR；热保护(TSD)；欠压闭锁；过流保护(OCP)；带使能；防倒灌; Operating Temperature: -40℃~+125℃@(Tj)
U10 = tps27s100apwpr: 类型:高侧开关;通道数:1;输入控制逻辑:高电平有效;工作电压:3.5V~40V;最大连续电流:4A;导通电阻:80mΩ;; Manufacturer: TI(德州仪器); AddInBom: yes; ModelId: 02f1f60386074b2ca8e111040ac061f2; ModelName: TSSOP-14_L5.0-W4.4-H1.0-LS6.4-P0.65; ModelTransform: 236.714,196.85,0,90,0,0,0,0.0005,0; Number of Channels: 1; Control Input Logic: 高电平有效; Maximum Continuous Current: 4A; RDS(on): 80mΩ; Symbol: TPS27S100APWPR; LCSC Part Name: 单通道高侧开关，具备全面诊断功能、宽工作电压范围和可调节电流限制; SupplierPart: C2879389; ManufacturerPart: TPS27S100APWPR; Supplier Footprint: HTSSOP-14-EP; JLCPCB Part Class: Extended Part; Datasheet: https://www.ti.com/cn/lit/ds/symlink/tps27s100.pdf; Supplier: LCSC; ConvertToPcb: yes; FootprintName: TSSOP-14_L5.0-W4.4-P0.65-LS6.4-BL-EP; Type: 高侧开关; Voltage - Supply: 3.5V~40V; Features: 集成电荷泵；短路保护；反向电流阻断；过温保护；过流保护；欠压锁定; Operating Temperature	-: -40℃~+125℃
X1 = x32258mob4si: 晶振类型:贴片晶振;频率:8MHz;常温频差:±10ppm;负载电容:12pF;频率稳定度:±20ppm;; Manufacturer: YXC(扬兴晶振); AddInBom: yes; ModelId: ff2dfd5650294453a14147960efe1838; ModelTransform: 125.984,98.425,0,0,0,0,0,0,0; Normal temperature Frequency Tolerance: ±10ppm; Load Capacitance: 12pF; Frequency Stability: ±20ppm; Equivalent Series Resistance(ESR): 180Ω; Symbol: X32258MOB4SI; LCSC Part Name: YSX321SL 8MHZ 4P 3225 12PF ±10PPM -40~85℃ (±20PPM); SupplierPart: C2682775; ManufacturerPart: X32258MOB4SI; Supplier Footprint: SMD3225-4P; JLCPCB Part Class: Extended Part; Datasheet: https://item.szlcsc.com/datasheet/X32258MOB4SI/2777872.html; Supplier: LCSC; ConvertToPcb: yes; FootprintName: CRYSTAL-SMD_4P-L3.2-W2.5-BL; ModelName: CRYSTAL-SMD_4P-L3.2-W2.5-BL; Type: 贴片晶振; Operating Temperature: -40℃~+85℃